# EasyEDA Pro project DTOT.eprj

# Schematic Schematic1
Board Name: Board1; Create Date: 2026-08-24; Page Name: P1; Project Name: DTOT; Schematic Name: Schematic1; Update Date: 2026-08-25; Company: EasyEDA.com; Page Size: A4; Version: V1.0
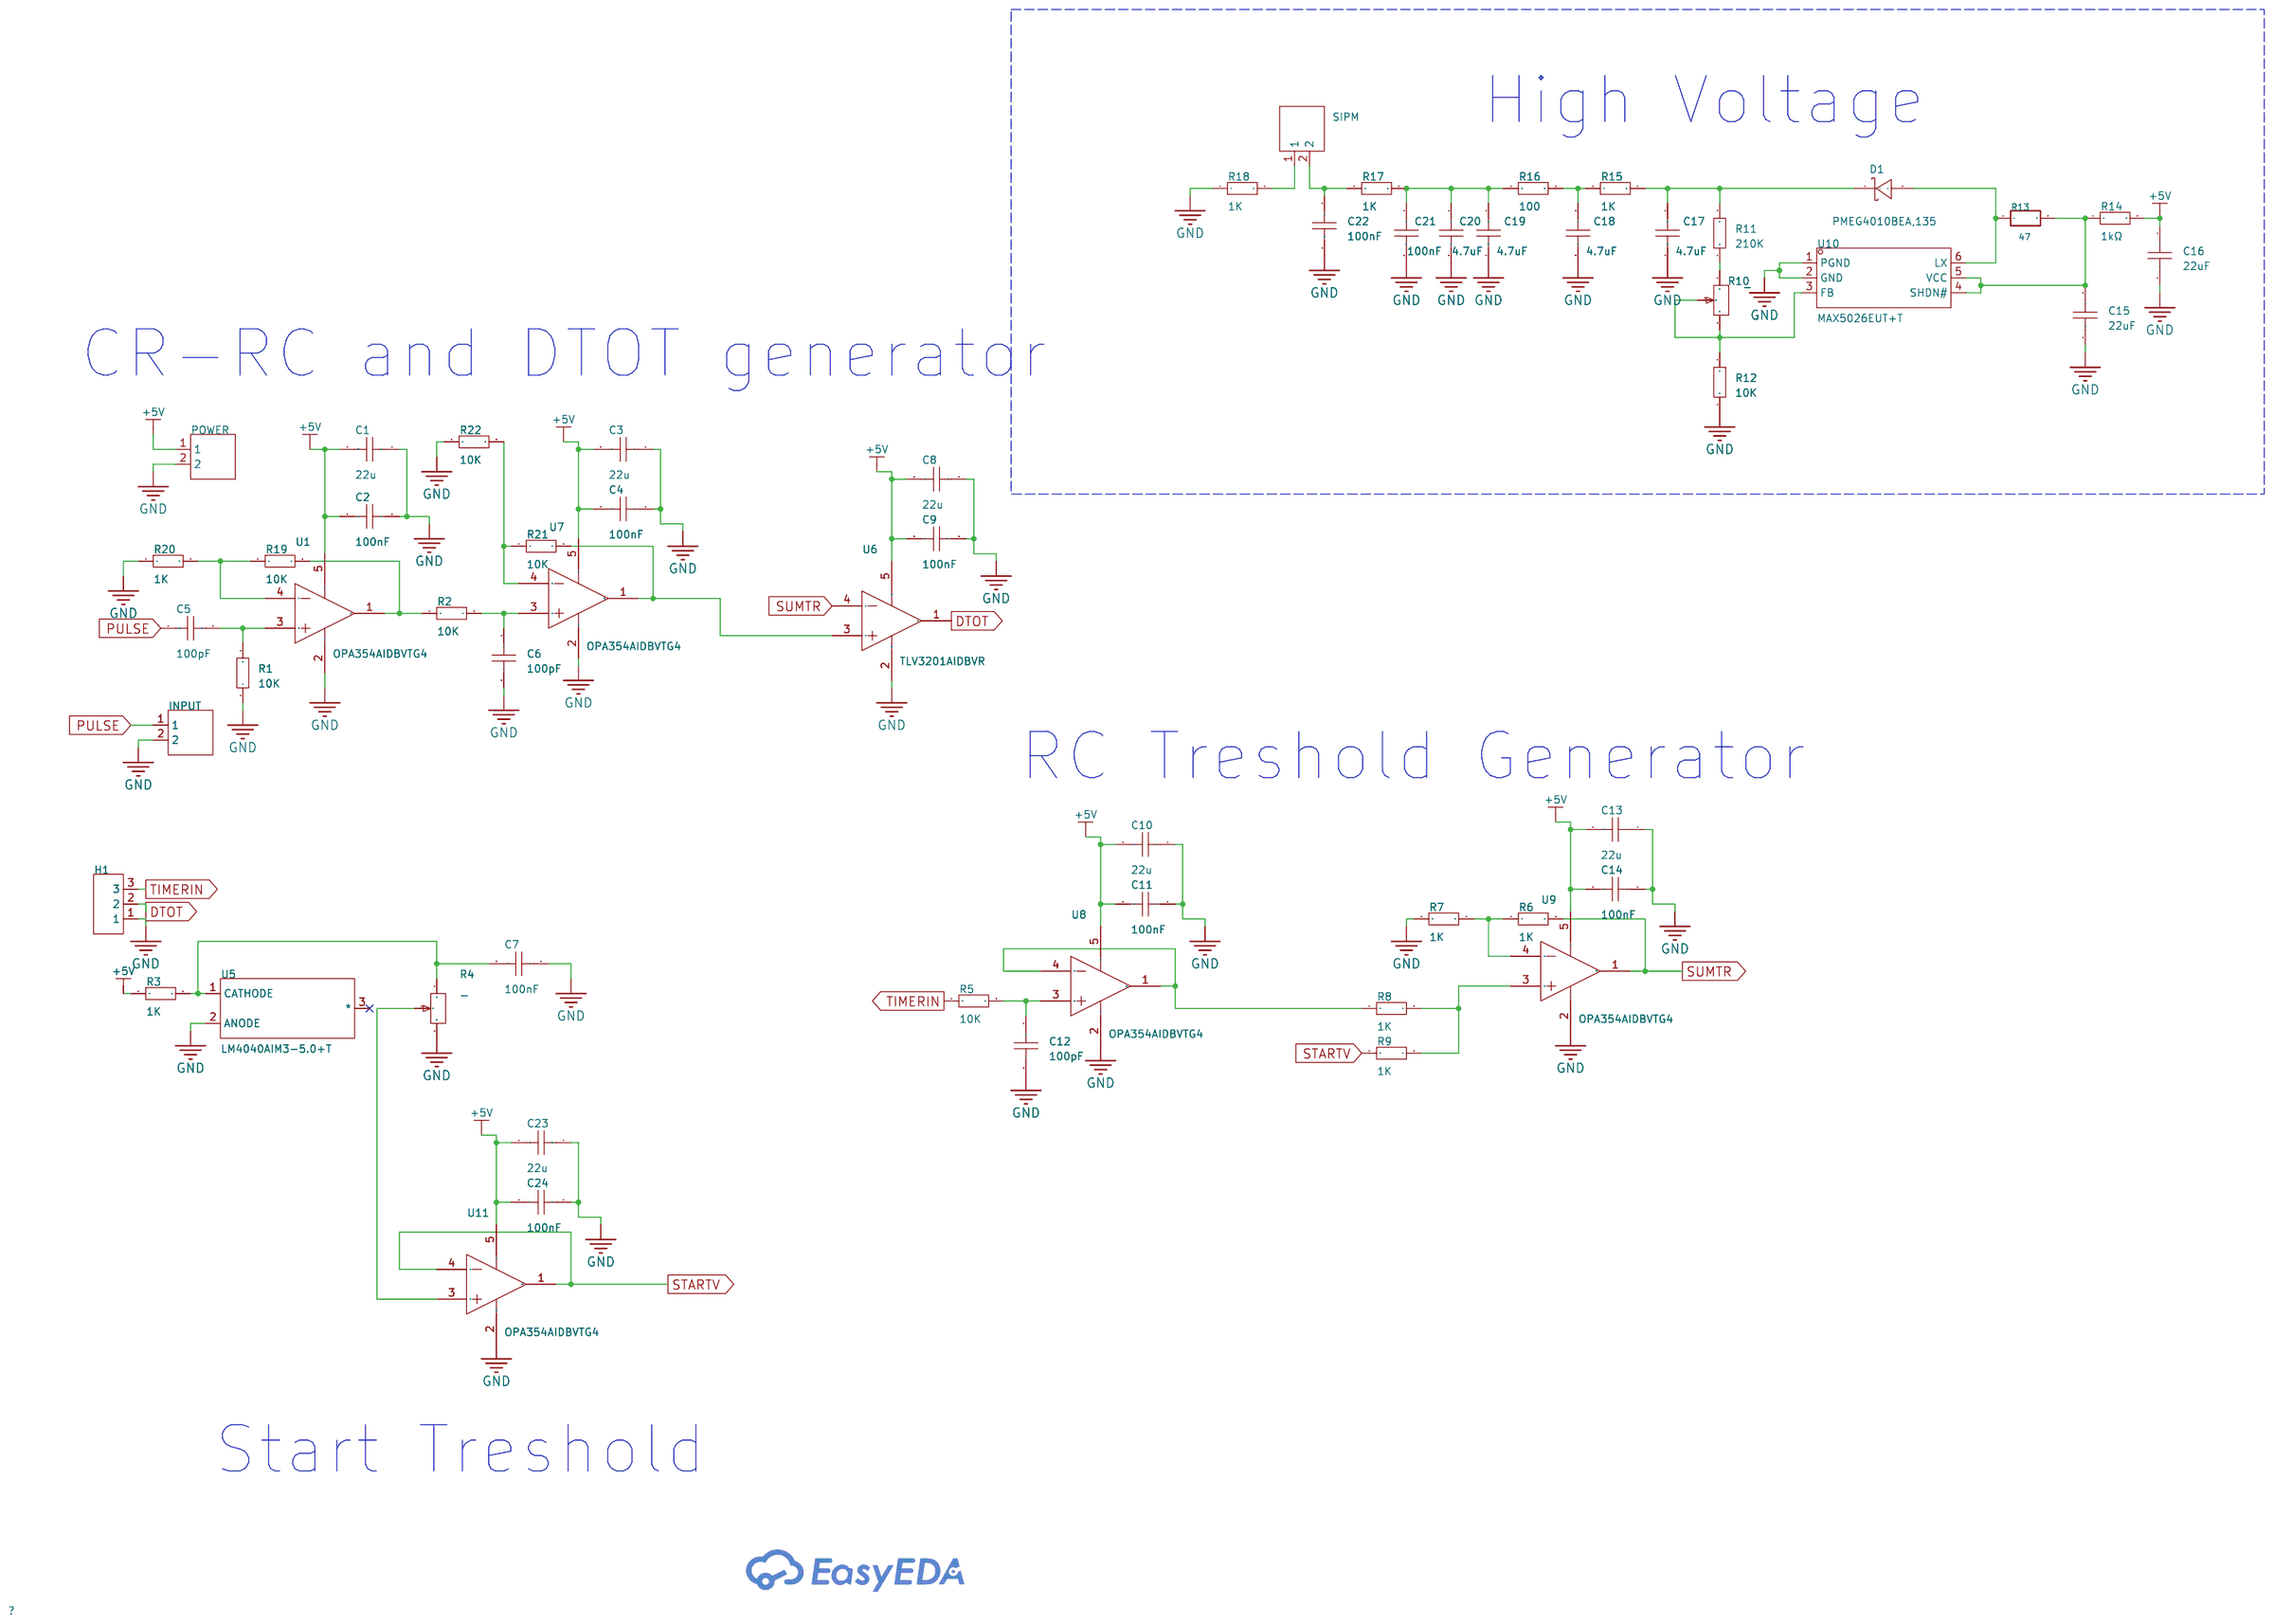
[diagram p0: schematic sheet]

## Parts
C1  22u  [C0603]
C2  100nF  [C0603]
C3  22u  [C0603]
C4  100nF  [C0603]
C5  100pF  [C0603]
C6  100pF  [C0603]
C7  100nF  [C0603]
C8  22u  [C0603]
C9  100nF  [C0603]
C10  22u  [C0603]
C11  100nF  [C0603]
C12  100pF  [C0603]
C13  22u  [C0603]
C14  100nF  [C0603]
C15  22uF  [C0603]
C16  22uF  [C0603]
C17  4.7uF  [C0603]
C18  4.7uF  [C0603]
C19  4.7uF  [C0603]
C20  4.7uF  [C0603]
C21  100nF  [C0603]
C22  100nF  [C0603]
C23  22u  [C0603]
C24  100nF  [C0603]
D1  PMEG4010BEA,135  [SOD-323_L1.8-W1.3-LS2.5-FD]
H1  -  [HDR-TH_3P-P2.54-V-M]
INPUT  -  [HDR-TH_2P-P2.54-V-M-1]
POWER  -  [HDR-TH_2P-P2.54-V-M-1]
R1  10K  [R0603]
R2  10K  [R0603]
R3  1K  [R0603]
R4  -  [RES-ADJ-TH_3P-L9.5-W4.85-P2.50-BL-BS]
R5  10K  [R0603]
R6  1K  [R0603]
R7  1K  [R0603]
R8  1K  [R0603]
R9  1K  [R0603]
R10  -  [RES-ADJ-TH_3P-L9.5-W4.85-P2.50-BL-BS]
R11  210K  [R0603]
R12  10K  [R0603]
R13  47  [RES-TH_BD4.5-L11.5-P15.50-D0.6]
R14  1kΩ  [R1206]
R15  1K  [R0603]
R16  100  [R0603]
R17  1K  [R0603]
R18  1K  [R0603]
R19  10K  [R0603]
R20  1K  [R0603]
R21  10K  [R0603]
R22  10K  [R0603]
SIPM  -  [HDR-TH_2P-P2.54-V-M-1]
U1  OPA354AIDBVTG4  [SOT-23-5_L3.0-W1.6-P0.95-LS2.8-BR]
U5  LM4040AIM3-5.0+T  [SOT-23-3_L2.9-W1.3-P1.90-LS2.4-BR]
U6  TLV3201AIDBVR  [SOT-23-5_L3.0-W1.7-P0.95-LS2.8-BR]
U7  OPA354AIDBVTG4  [SOT-23-5_L3.0-W1.6-P0.95-LS2.8-BR]
U8  OPA354AIDBVTG4  [SOT-23-5_L3.0-W1.6-P0.95-LS2.8-BR]
U9  OPA354AIDBVTG4  [SOT-23-5_L3.0-W1.6-P0.95-LS2.8-BR]
U10  MAX5026EUT+T  [SOT-23-6_L2.9-W1.6-P0.95-LS2.8-BL]
U11  OPA354AIDBVTG4  [SOT-23-5_L3.0-W1.6-P0.95-LS2.8-BR]

## Library data of the parts
C1-C24 = CAP_0603: Supplier Footprint: 0603
D1 = PMEG4010BEA,135: LCSC Part Name: 电压:40V 电流:1A; Supplier Part: C552896; Manufacturer: Nexperia(安世); Supplier Footprint: SOD-323; JLCPCB Part Class: Extended Part; Datasheet: https://item.szlcsc.com/datasheet/PMEG4010BEA%252C135/573893.html; Supplier: LCSC; Voltage - Forward(Vf@If): 640mV@1A; Voltage - DC Reverse(Vr): 40V; Current - Rectified: 1A; Reverse Leakage Current (Ir): 100uA@40V
H1 = HDR-M_2.54_1x3P: Supplier Footprint: Through
INPUT POWER SIPM = HDR-M_2.54_1x2P: Supplier Footprint: Through
R1-R3 R5-R9 R11 R12 R15-R22 = Res_0603: Supplier Footprint: 0603
R4 R10 = 3296W-1-105: LCSC Part Name: 1MΩ ±0.25% ±250ppm/℃; Supplier Part: C5027; Supplier Footprint: 3296W; JLCPCB Part Class: Extended Part; Supplier: LCSC
R13 = MF02SFF1001A10: LCSC Part Name: 金属膜电阻 1kΩ ±1% 2W; Supplier Part: C20625259; Manufacturer: UNI-ROYAL(厚声); Supplier Footprint: 插件,D4.5xL11.5mm; JLCPCB Part Class: Extended Part; Datasheet: https://item.szlcsc.com/datasheet/MF02SFF1001A10/22028752.html; Supplier: LCSC; Type: Metal Film Resistor; Tolerance: ±1%; Power(Watts): 2W; Temperature Coefficient: ±50ppm/℃
R14 = Res_1206: Supplier Footprint: 1206
U1 U7-U9 U11 = OPA354AIDBVTG4: Supplier Part: C2059391; Manufacturer: TI(德州仪器); Supplier Footprint: SOT-23-5; JLCPCB Part Class: Extended Part; Datasheet: https://www.ti.com/cn/lit/gpn/opa354; Supplier: LCSC; Number of Channels: 1; Maximum Power Supply Range (Vdd-Vss): 5.5V; Rail to Rail: Rail-to-Rail Input, Rail-to-Rail Output; Gain Bandwidth Product: 100MHz; Vos - Input Offset Voltage: 2mV; Input Offset Voltage Drift(Vos TC): 4uV/℃; Slew Rate: 150V/us; Ib - Input Bias Current: 50pA; Input Offset Current(Ios): 1pA; Input Voltage Noise Density: 6.5nV/√Hz@1MHz; Common Mode Rejection Ratio(CMRR): 66dB; Quiescent Current: 4.9mA; Output Current: 100mA; Operating Temperature: -40℃~+125℃; Single supply: 2.5V~5.5V; Dual Supply: 1.25V~2.75V；-2.75V~-1.25V
U5 = LM4040AIM3-5.0+T: LCSC Part Name: LM4040 改进精度微功耗分流电压基准源，具有多种反向击穿电压; Supplier Part: C2157609; Manufacturer: ADI(亚德诺)/MAXIM(美信); Supplier Footprint: SOT-23-3; JLCPCB Part Class: Extended Part; Datasheet: https://item.szlcsc.com/datasheet/LM4040AIM3-5.0%252BT/2249659.html; Supplier: LCSC; Output Type: Fixed; Output Voltage: 5V; Output Current: 15mA; Tolerance: ±0.1%; Temperature Coefficient: 100ppm/℃; Reference Type: Parallel; Operating Temperature: -40℃~+85℃@(Ta)
U6 = TLV3201AIDBVR: LCSC Part Name: 40纳秒低功耗推挽输出比较器; Supplier Part: C105188; Manufacturer: TI(德州仪器); Supplier Footprint: SOT-23-5; JLCPCB Part Class: Extended Part; Datasheet: https://www.ti.com/cn/lit/gpn/tlv3201; Supplier: LCSC; Number of Channels: 1; Vos - Input Offset Voltage: 1mV; Ib - Input Bias Current: 1pA; Propagation Delay Time: 40ns; Input Hysteresis Voltage (Vhys): 1mV; Output Type: CMOS; Rail to Rail: Rail-to-Rail Input; Quiescent Current: 40uA; Operating Temperature: -40℃~+125℃
U10 = MAX5026EUT+T: LCSC Part Name: 升压型 3V~11V; Supplier Part: C87603; Manufacturer: ADI(亚德诺)/MAXIM(美信); Supplier Footprint: SOT-23-6; Datasheet: https://item.szlcsc.com/datasheet/MAX5026EUT%252BT/88781.html; Supplier: LCSC; Function: Boost; Voltage - Supply: 3V~11V; Output Voltage: 4V~36V; Frequency - Switching: 500kHz; Operating Temperature: -40℃~+85℃; Synchronous Rectifier: No; Number of Outputs: 1; Topology: Boost; Quiescent Current: 350uA; Switch tube (built-in/external): Built-in; Output Type: Adjustable; Features: Cycle-by-cycle current limiting

## Nets
+5V: C1.2 C2.2 C3.2 C4.2 C8.2 C9.2 C10.2 C11.2 C13.2 C14.2 C16.1 C23.2 C24.2 POWER.1 R3.1 R14.2 U1.5(V+) U6.5(VCC) U7.5(V+) U8.5(V+) U9.5(V+) U11.5(V+)
GND: C1.1 C2.1 C3.1 C4.1 C6.2 C7.1 C8.1 C9.1 C10.1 C11.1 C12.2 C13.1 C14.1 C15.2 C16.2 C17.2 C18.2 C19.2 C20.2 C21.2 C22.2 C23.1 C24.1 H1.1 INPUT.2 POWER.2 R1.1 R4.3 R7.1 R12.1 R18.1 R20.1 R22.1 U1.2(V-) U5.2(ANODE) U6.2(GND) U7.2(V-) U8.2(V-) U9.2(V-) U10.1(PGND) U10.2(GND) U11.2(V-)
DTOT: H1.2 U6.1(OUT)
PULSE: C5.2 INPUT.1
STARTV: R9.1 U11.1(OUT) U11.4(-IN)
SUMTR: R6.2 U6.4(IN-) U9.1(OUT)
TIMERIN: H1.3 R5.1
$1N882: C5.1 R1.2 U1.3(+IN)
$1N1026: C6.1 R2.2 U7.3(+IN)
$1N1136: C7.2 R3.2 R4.1 U5.1(CATHODE)
$1N1899: R8.1 U8.1(OUT) U8.4(-IN)
$1N1962: C12.1 R5.2 U8.3(+IN)
$1N2275: R6.1 R7.2 U9.4(-IN)
$1N2425: R8.2 R9.2 U9.3(+IN)
$1N4696: D1.1(A) R13.1 U10.6(LX)
$1N4832: R10.2 R10.3 R12.2 U10.3(FB)
$1N4836: R10.1 R11.1
$1N4869: C17.1 D1.2(K) R11.2 R15.2
$1N5004: C15.1 R13.2 R14.1 U10.4(SHDN#) U10.5(VCC)
$1N5291: C18.1 R15.1 R16.2
$1N5390: C19.1 C20.1 C21.1 R16.1 R17.2
$1N5634: C22.1 R17.1 SIPM.2
$1N5753: R18.2 SIPM.1
$1N7113: R4.2 U11.3(+IN)
$1N7182: R19.1 R20.2 U1.4(-IN)
$1N7188: R2.1 R19.2 U1.1(OUT)
$1N7272: R21.1 R22.2 U7.4(-IN)
$1N7280: R21.2 U6.3(IN+) U7.1(OUT)

Not connected (* = marked no-connect by the designer): U5 3(*)*

## Notes on the sheet
- High Voltage
- CR-RC and DTOT generator
- RC Treshold Generator
- Start Treshold

# Board PCB1
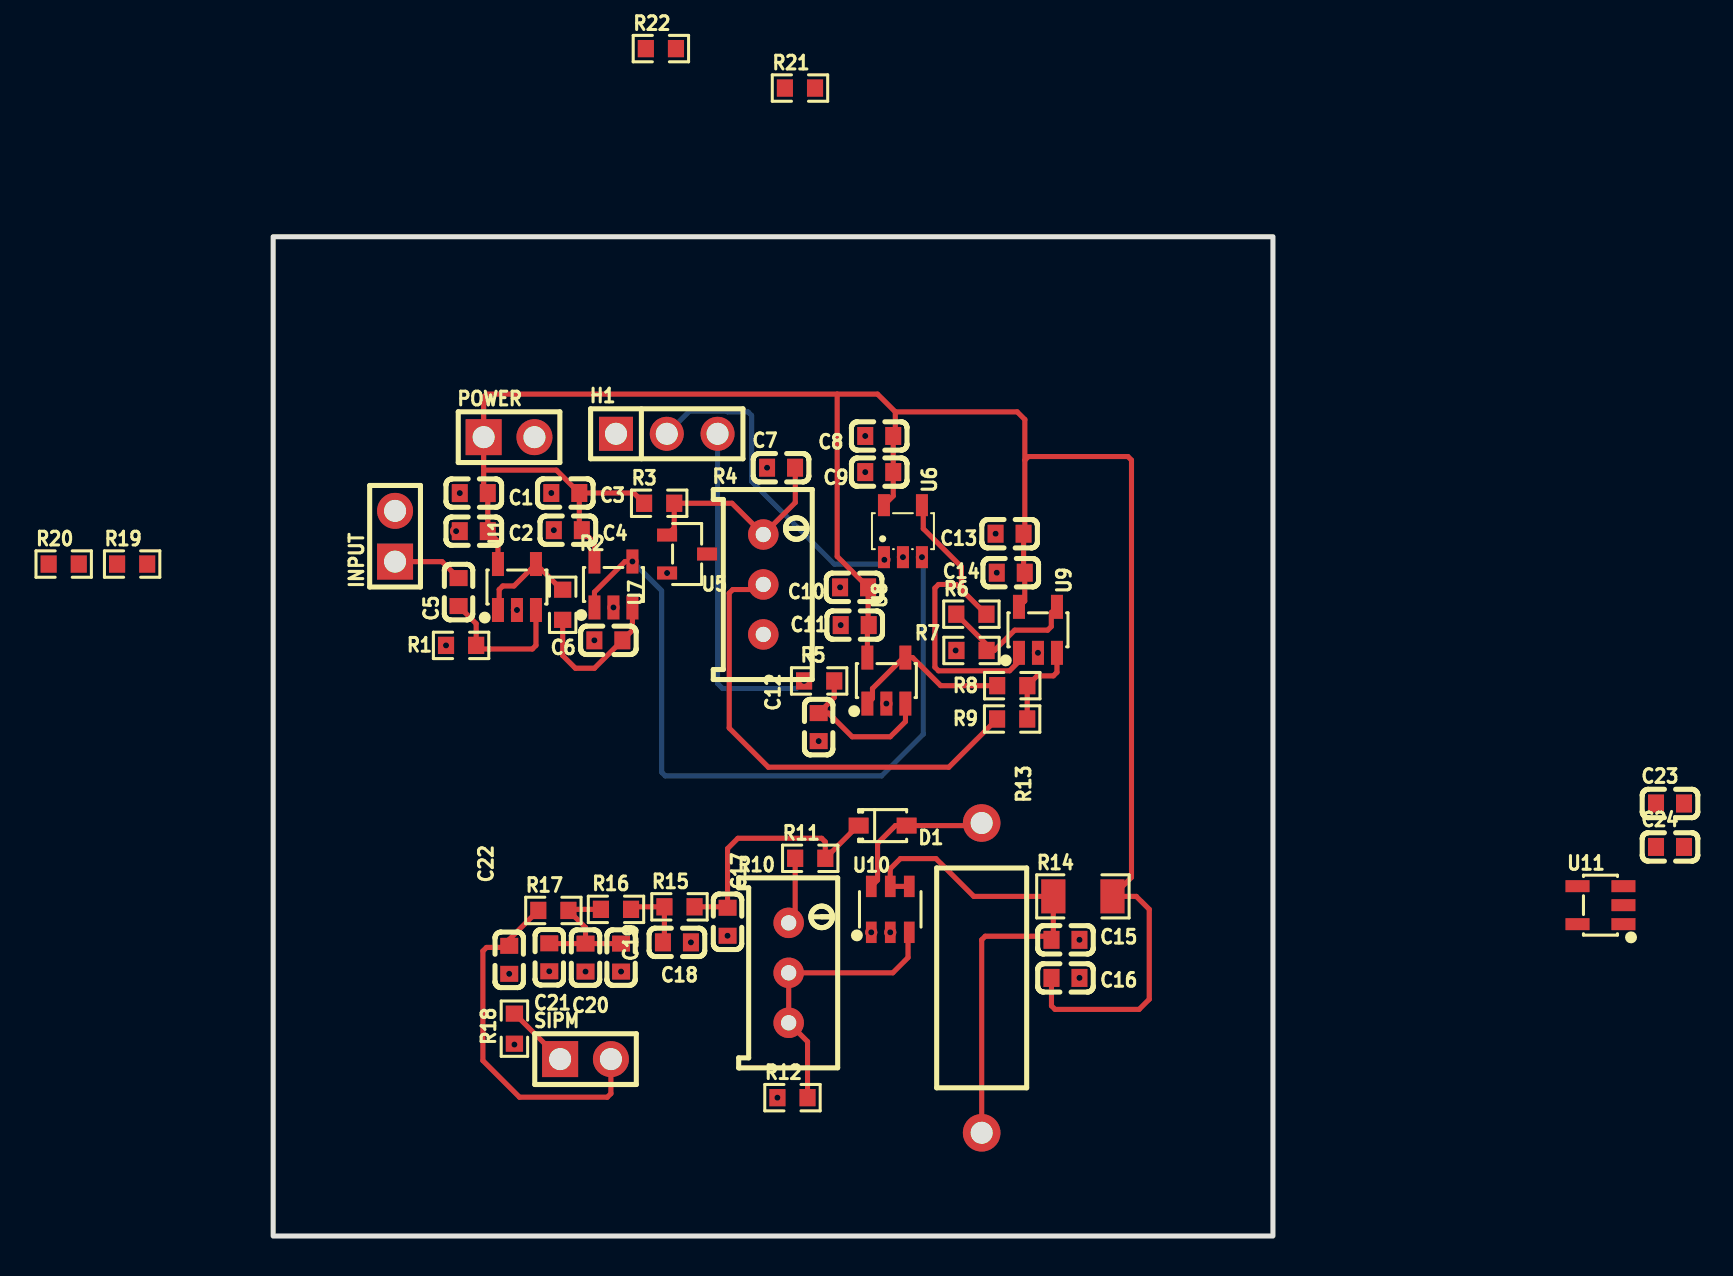
[diagram p1: board, top side]
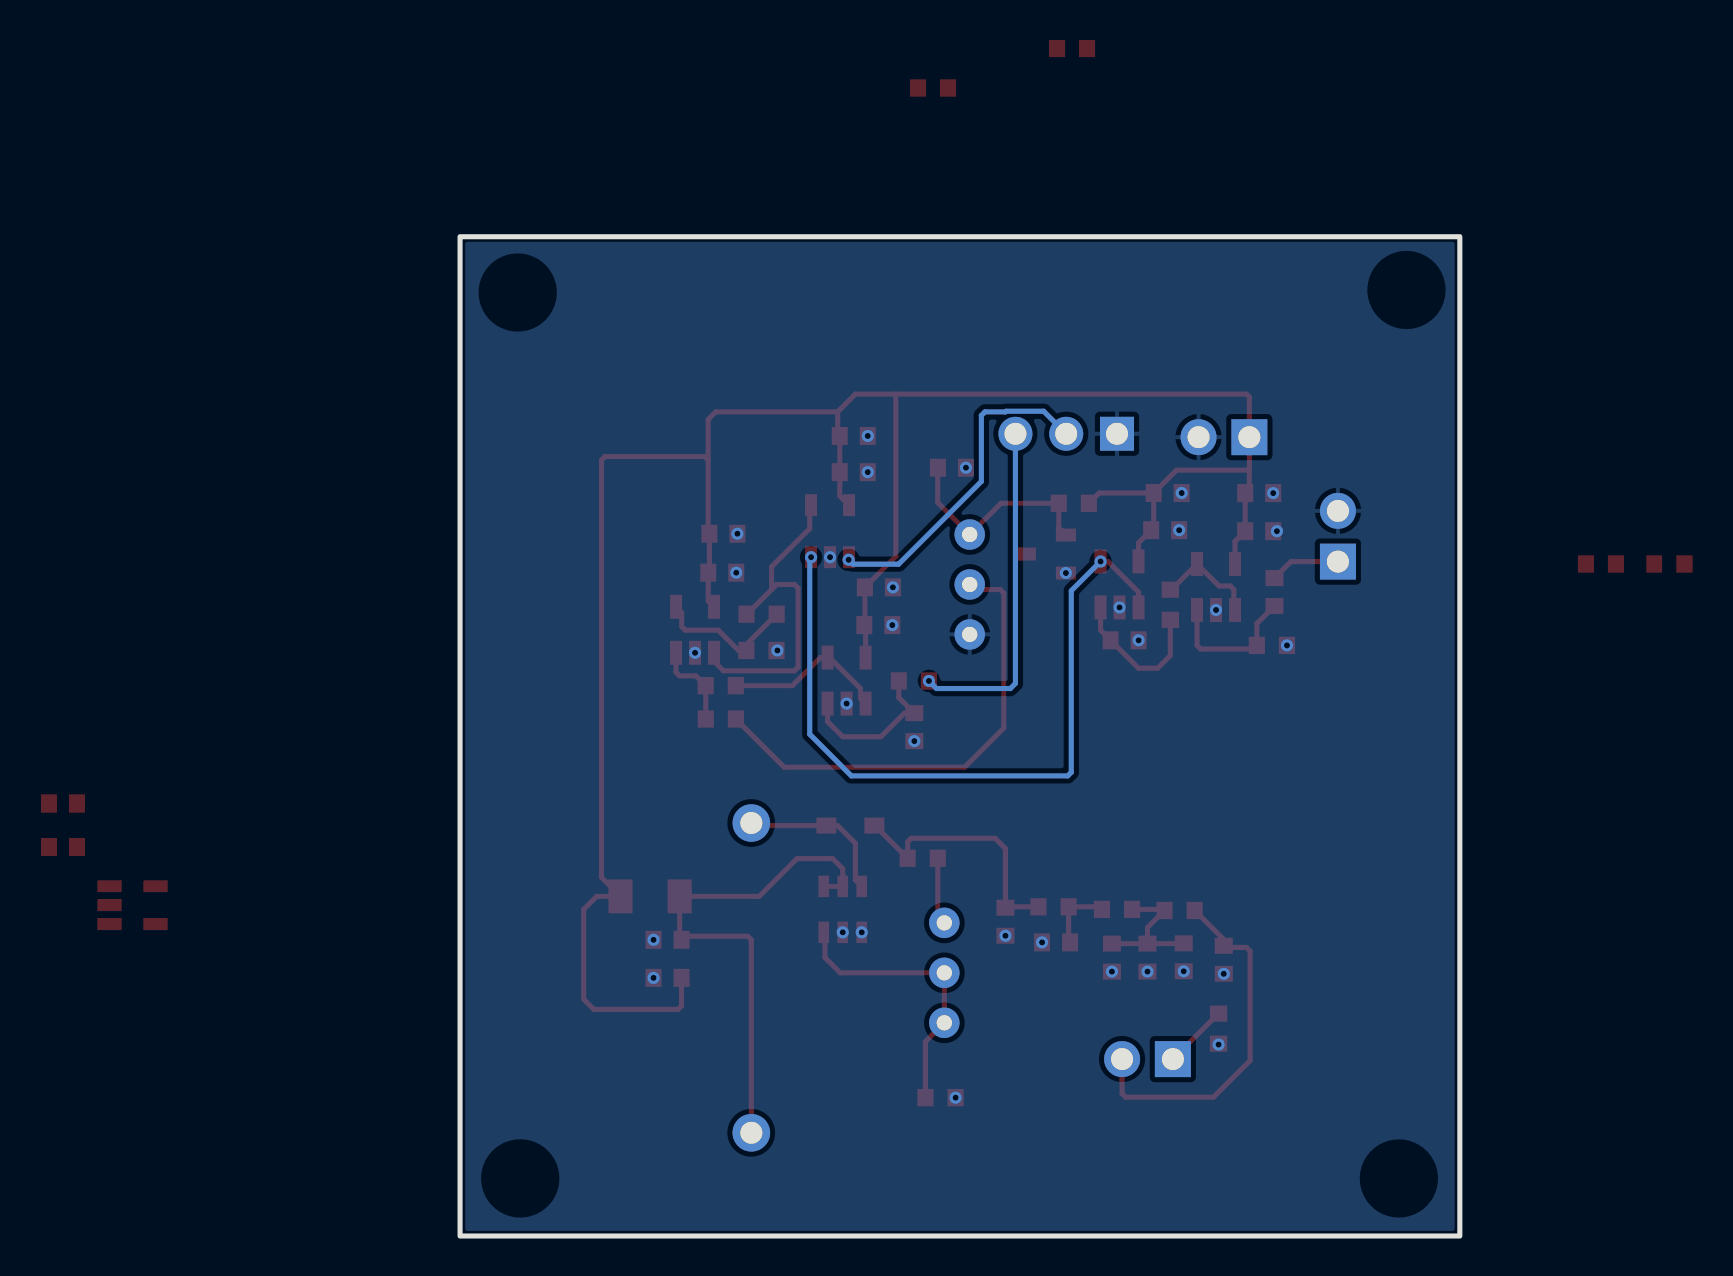
[diagram p2: board, bottom side, seen from below]

Outline 50 x 50 mm; copper layers: Top Layer, Bottom Layer. Coordinates in mm from the lower left corner of the outline.
Outline path: rectangle 0,50 50,0
Stack: Top Layer 0.035mm / Dielectric1 1.51mm FR4 er 4.5 / Bottom Layer 0.035mm

## Design rules (mm)
template: JLCPCB Capability(Two Layers Board)
spacing copperThickness1oz (default): track to track 0.102, other pairs 0.152 to 0.3
spacing copperThickness2oz: track to track 0.203, other pairs 0.152 to 0.3
track width copperThickness1oz (default): min 0.127, default 0.254, max 2.54
track width copperThickness2oz: min 0.203, default 0.254, max 2.54
differential pair differentialPair (default): width min 0.127, default 0.254, max 2.54; gap min 0.152, default 0.152
via viaSize (default): diameter min 0.5, default 0.61, max 10; hole min 0.3, default 0.305, max 6.3

## Placement (name value [footprint] x y rotation side)
C1  22u  [C0603]  10.03 37.17 0 top
C2  100nF  [C0603]  10.03 35.27 0 top
C3  22u  [C0603]  14.61 37.18 0 top
C4  100nF  [C0603]  14.74 35.32 0 top
C5  100pF  [C0603]  9.27 32.22 90 top
C6  100pF  [C0603]  16.76 29.81 180 top
C7  100nF  [C0603]  25.4 38.44 0 top
C8  22u  [C0603]  30.31 40.03 0 top
C9  100nF  [C0603]  30.31 38.22 0 top
C10  22u  [C0603]  29.05 32.46 0 top
C11  100nF  [C0603]  29.08 30.57 0 top
C12  100pF  [C0603]  27.28 25.46 270 top
C13  22u  [C0603]  36.83 35.14 0 top
C14  100nF  [C0603]  36.89 33.19 0 top
C15  22uF  [C0603]  39.62 14.82 0 top
C16  22uF  [C0603]  39.62 12.92 0 top
C17  4.7uF  [C0603]  22.72 15.73 270 top
C18  4.7uF  [C0603]  20.19 14.69 0 top
C19  4.7uF  [C0603]  17.4 13.93 270 top
C20  4.7uF  [C0603]  15.62 13.93 270 top
C21  100nF  [C0603]  13.81 13.95 270 top
C22  100nF  [C0603]  11.8 13.82 270 top
C23  22u  [C0603]  69.86 21.64 0 top
C24  100nF  [C0603]  69.86 19.47 0 top
D1  PMEG4010BEA,135  [SOD-323_L1.8-W1.3-LS2.5-FD]  30.48 20.54 180 top
H1  -  [HDR-TH_3P-P2.54-V-M]  19.69 40.14 0 top
INPUT  -  [HDR-TH_2P-P2.54-V-M-1]  6.1 35.01 90 top
POWER  -  [HDR-TH_2P-P2.54-V-M-1]  11.8 39.97 0 top
R1  10K  [R0603]  9.4 29.55 0 top
R2  10K  [R0603]  14.48 31.59 270 top
R3  1K  [R0603]  19.3 36.67 0 top
R4  -  [RES-ADJ-TH_3P-L9.5-W4.85-P2.50-BL-BS]  24.51 32.6 0 top
R5  10K  [R0603]  27.31 27.78 0 top
R6  1K  [R0603]  34.92 31.11 0 top
R7  1K  [R0603]  34.93 29.3 0 top
R8  1K  [R0603]  36.96 27.54 0 top
R9  1K  [R0603]  36.96 25.87 0 top
R10  -  [RES-ADJ-TH_3P-L9.5-W4.85-P2.50-BL-BS]  25.78 13.17 0 top
R11  210K  [R0603]  26.86 18.9 0 top
R12  10K  [R0603]  25.97 6.92 0 top
R13  47  [RES-TH_BD4.5-L11.5-P15.50-D0.6]  35.43 12.92 270 top
R14  1kΩ  [R1206]  40.5 17 0 top
R15  1K  [R0603]  20.32 16.47 0 top
R16  100  [R0603]  17.15 16.34 0 top
R17  1K  [R0603]  14.01 16.29 0 top
R18  1K  [R0603]  12.06 10.38 90 top
R19  10K  [R0603]  -7.05 33.62 0 top
R20  1K  [R0603]  -10.48 33.62 0 top
R21  10K  [R0603]  26.35 57.44 0 top
R22  10K  [R0603]  19.39 59.41 0 top
SIPM  -  [HDR-TH_2P-P2.54-V-M-1]  15.62 8.85 0 top
U1  OPA354AIDBVTG4  [SOT-23-5_L3.0-W1.6-P0.95-LS2.8-BR]  12.19 32.47 270 top
U5  LM4040AIM3-5.0+T  [SOT-23-3_L2.9-W1.3-P1.90-LS2.4-BR]  20.7 34.12 180 top
U6  TLV3201AIDBVR  [SOT-23-5_L3.0-W1.7-P0.95-LS2.8-BR]  31.5 35.27 270 top
U7  OPA354AIDBVTG4  [SOT-23-5_L3.0-W1.6-P0.95-LS2.8-BR]  17.02 32.6 270 top
U8  OPA354AIDBVTG4  [SOT-23-5_L3.0-W1.6-P0.95-LS2.8-BR]  30.67 27.79 270 top
U9  OPA354AIDBVTG4  [SOT-23-5_L3.0-W1.6-P0.95-LS2.8-BR]  38.25 30.33 270 top
U10  MAX5026EUT+T  [SOT-23-6_L2.9-W1.6-P0.95-LS2.8-BL]  30.86 16.34 0 top
U11  OPA354AIDBVTG4  [SOT-23-5_L3.0-W1.6-P0.95-LS2.8-BR]  66.38 16.56 0 top

## Footprints (pads in the part's own frame, mm; a bottom-side part is the same pattern mirrored in y, then rotated)
C0603
  rect 0.8x0.9 smd: 1(-0.7,0) 2(0.7,0)
HDR-TH_2P-P2.54-V-M-1
  rect 1.8x1.8 hole 1.1: 1(-1.27,0)
  round 1.8 hole 1.1: 2(1.27,0)
HDR-TH_3P-P2.54-V-M
  rect 1.7x1.7 hole 1.1: 1(-2.54,0)
  round 1.7 hole 1.1: 2(0,0) 3(2.54,0)
R0603
  rect 0.806x0.864 smd: 1(-0.753,0) 2(0.753,0)
R1206
  rect 1.208x1.701 smd: 1(-1.479,0) 2(1.479,0)
RES-ADJ-TH_3P-L9.5-W4.85-P2.50-BL-BS
  round 1.524 hole 0.762: 1(0,2.5) 2(0,0) 3(0,-2.5)
RES-TH_BD4.5-L11.5-P15.50-D0.6
  round 1.879 hole 1.1: 1(-7.75,0) 2(7.75,0)
SOD-323_L1.8-W1.3-LS2.5-FD
  rect 1x0.8 smd: 1(-1.2,0) 2(1.2,0)
SOT-23-3_L2.9-W1.3-P1.90-LS2.4-BR
  rect 1x0.65 smd: 1(1,-0.95) 2(1,0.95) 3(-1,0)
SOT-23-5_L3.0-W1.6-P0.95-LS2.8-BR
  rect 1.2x0.6 smd: 1(1.15,-0.95) 2(1.15,0) 3(1.15,0.95) 4(-1.15,0.95) 5(-1.15,-0.95)
SOT-23-5_L3.0-W1.7-P0.95-LS2.8-BR
  rect 1.1x0.6 smd: 1(1.3,-0.95) 2(1.3,0) 3(1.3,0.95) 4(-1.3,0.95) 5(-1.3,-0.95)
SOT-23-6_L2.9-W1.6-P0.95-LS2.8-BL
  rect 0.532x1.072 smd: 1(-0.95,-1.149) 2(0,-1.149) 3(0.95,-1.149) 4(0.95,1.149) 5(0,1.149) 6(-0.95,1.149)

## Nets
As in the schematic.

Pads without a net: U5 3

## Via types
v1: diameter 0.61, hole 0.305, Top Layer to Bottom Layer, 37 vias

## Routing (per net, layer and track width the routed paths; a pad name or vN(x,y) marks a point on that pad's centre or on a via; arc(x,y) is an arc through that point)
+5V: length 118
  Top Layer w0.254: 29.75,30.6 C10.2 28.21,34 28.21,42.13 ; 29.75,30.6 C11.2 ; 29.75,30.6 29.72,30.56 U8.5 ; 28.21,42.13 10.67,42.13 10.53,41.98 POWER.1 10.53,38.32 ; 28.21,42.13 30.23,42.13 31.12,41.24 ; 10.53,38.32 14.17,38.32 C3.2 ; 10.53,38.32 10.53,37.38 C1.2 C2.2 11.24,34.76 U1.5 ; 31.12,41.24 37.21,41.24 37.59,40.86 37.59,38.82 ; 31.12,41.24 31.12,40.14 C8.2 C9.2 31.01,37.03 U6.5 ; 37.59,38.82 37.77,39 42.75,39 42.93,38.82 42.93,17.95 R14.2 43.16,17 43.81,16.34 43.81,11.85 43.31,11.34 39.1,11.34 38.92,11.52 C16.1 ; 37.59,38.82 37.59,35.2 C13.2 37.53,33.25 C14.2 37.59,31.77 U9.5 ; C3.2 18.04,37.18 R3.1 ; C3.2 15.31,35.44 C4.2 16.07,34.69 U7.5
GND:
  vias: v1(8.64,29.55) v1(9.15,35.27) v1(9.33,37.17) v1(11.8,13.12) v1(12.06,9.58) v1(12.19,31.32) v1(13.81,13.25) v1(13.91,37.18) v1(14.04,35.32) v1(15.62,13.23) v1(16.06,29.81) v1(17.02,31.45) v1(17.4,13.23) v1(19.7,33.18) v1(20.89,14.69) v1(22.72,15.03) v1(24.7,38.44) v1(25.22,6.92) v1(27.28,24.76) v1(28.35,32.46) v1(28.38,30.57) v1(29.61,40.03) v1(29.61,38.22) v1(29.91,15.2) v1(30.67,26.64) v1(30.86,15.2) v1(31.5,33.97) v1(34.13,29.3) v1(36.13,35.14) v1(36.19,33.19) v1(38.25,29.18) v1(40.32,14.82) v1(40.32,12.92)
DTOT: length 16.5
  Bottom Layer w0.254: H1.2 20.81,41.27 22.69,41.27 22.73,41.24 23.75,41.24 23.93,41.06 23.93,37.76 28.07,33.62 30.35,33.62 v1(30.57,33.84)
PULSE: length 3.5
  Top Layer w0.254: C5.2 8.45,33.74 INPUT.1
SUMTR: length 17.2
  Top Layer w0.254: 34.42,32.35 34.16,32.6 33.27,32.6 33.09,32.42 33.09,28.46 33.27,28.28 36.83,28.28 37.3,28.75 U9.1 ; 34.42,32.35 35.65,31.11 R6.2 ; 34.42,32.35 34.42,33.49 32.51,35.4 32.51,36.5 U6.4
TIMERIN: length 17.1
  Bottom Layer w0.254: v1(26.55,27.78) 26.17,27.39 22.48,27.39 22.22,27.65 H1.3
$1N882: length 7.2
  Top Layer w0.254: U1.3 13.14,29.55 12.96,29.37 10.33,29.37 R1.2 10.15,30.64 C5.1
$1N1026: length 7.5
  Top Layer w0.254: 17.97,31.45 17.97,30.31 C6.1 16.07,28.41 15.11,28.41 14.48,29.05 R2.2
$1N1136: length 10.8
  Top Layer w0.254: 26.11,38.41 26.11,36.7 R4.1 22.95,36.67 R3.2 20.06,35.43 U5.1
$1N1899: length 8.3
  Top Layer w0.254: U8.1 29.97,26.9 29.97,27.39 31.52,28.94 U8.4 31.98,28.94 33.38,27.54 R8.1
$1N1962: length 8
  Top Layer w0.254: R5.2 28.06,26.94 C12.1 27.77,26.16 28.96,24.98 30.86,24.98 31.62,25.74 31.62,26.64 U8.3
$1N2275: length 7.3
  Top Layer w0.254: R6.1 35.68,29.6 R7.2 36.07,29.3 37.08,30.32 38.74,30.32 38.91,30.49 38.91,31.2 U9.4
$1N2425: length 4.4
  Top Layer w0.254: R9.2 37.71,27.53 R8.2 38.21,28.03 39.02,28.03 39.2,28.21 U9.3
$1N4696: length 7.9
  Top Layer w0.254: U10.6 30.23,17.81 30.23,19.65 31.12,20.54 D1.1 35.3,20.54 R13.1
$1N4832: length 14.2
  Top Layer w0.254: 31.81,15.2 31.75,15.14 31.75,13.93 30.99,13.17 R10.2 R10.3 26.72,9.73 R12.2
$1N4836: length 3.4
  Top Layer w0.254: R10.1 26.11,16 R11.1
$1N4869: length 13
  Top Layer w0.254: D1.2 29.25,20.54 R11.2 ; 27.61,18.9 27.61,19.72 27.43,19.9 23.24,19.9 22.72,19.38 C17.1 22.68,16.47 R15.2
$1N5004: length 26.5
  Top Layer w0.254: 31.81,17.49 U10.5 30.86,18.38 31.37,18.89 33.15,18.89 35.04,17 R14.1 39.02,14.91 C15.1 38.74,15 35.61,15 35.43,14.82 R13.2
$1N5291: length 3.5
  Top Layer w0.254: R16.2 18.03,16.47 R15.1 19.57,14.77 19.49,14.69
$1N5390: length 7.3
  Top Layer w0.254: R16.1 14.82,16.34 R17.2 15.62,15.44 C20.1 ; C19.1 C20.1 ; C20.1 13.82,14.63 C21.1
$1N5634: length 18.2
  Top Layer w0.254: SIPM.2 16.89,7.13 16.71,6.95 12.32,6.95 10.49,8.78 10.49,14.26 10.67,14.44 11.72,14.44 C22.1 11.8,14.84 R17.1
$1N5753: length 3.2
  Top Layer w0.254: SIPM.1 12.07,11.13 R18.2
$1N7113: length 23.8
  Top Layer w0.254: 36.2,25.87 33.79,23.46 24.76,23.46 22.81,25.41 22.81,32.17 22.99,32.35 24.26,32.35 R4.2
$1N7188: length 5.3
  Top Layer w0.254: R2.1 14.43,32.34 13.14,33.62 12.04,32.53 11.48,32.53 11.3,32.35 11.3,31.39 U1.1
$1N7272:
  vias: v1(17.97,33.75)
$1N7280: length 37.4
  Top Layer w0.254: 16.07,31.45 16.07,32.22 17.6,33.75 17.97,33.75
  Bottom Layer w0.254: 17.97,33.75 19.43,32.29 19.43,23.2 19.61,23.02 30.43,23.02 32.51,25.11 32.51,33.9 v1(32.45,33.97)

## Copper pours and planes (outline as drawn; the poured copper is in the pictures)
GND on Bottom Layer: 0,50 50,50 50,0 0,0
